# Altium schematic sheet 06-Receiver.SchDoc: Receiver
size A4; Organization: ORGANIZATION; Address1: ADDRESS 1; Address2: ADDRESS 2; Address3: ADDRESS 3; Address4: ADDRESS 4; SheetNumber: 6; SheetTotal: 7; ENG_APP_DATE: --/--/--; DSN_APP_DATE: --/--/--; CHK_APP_DATE: --/--/--
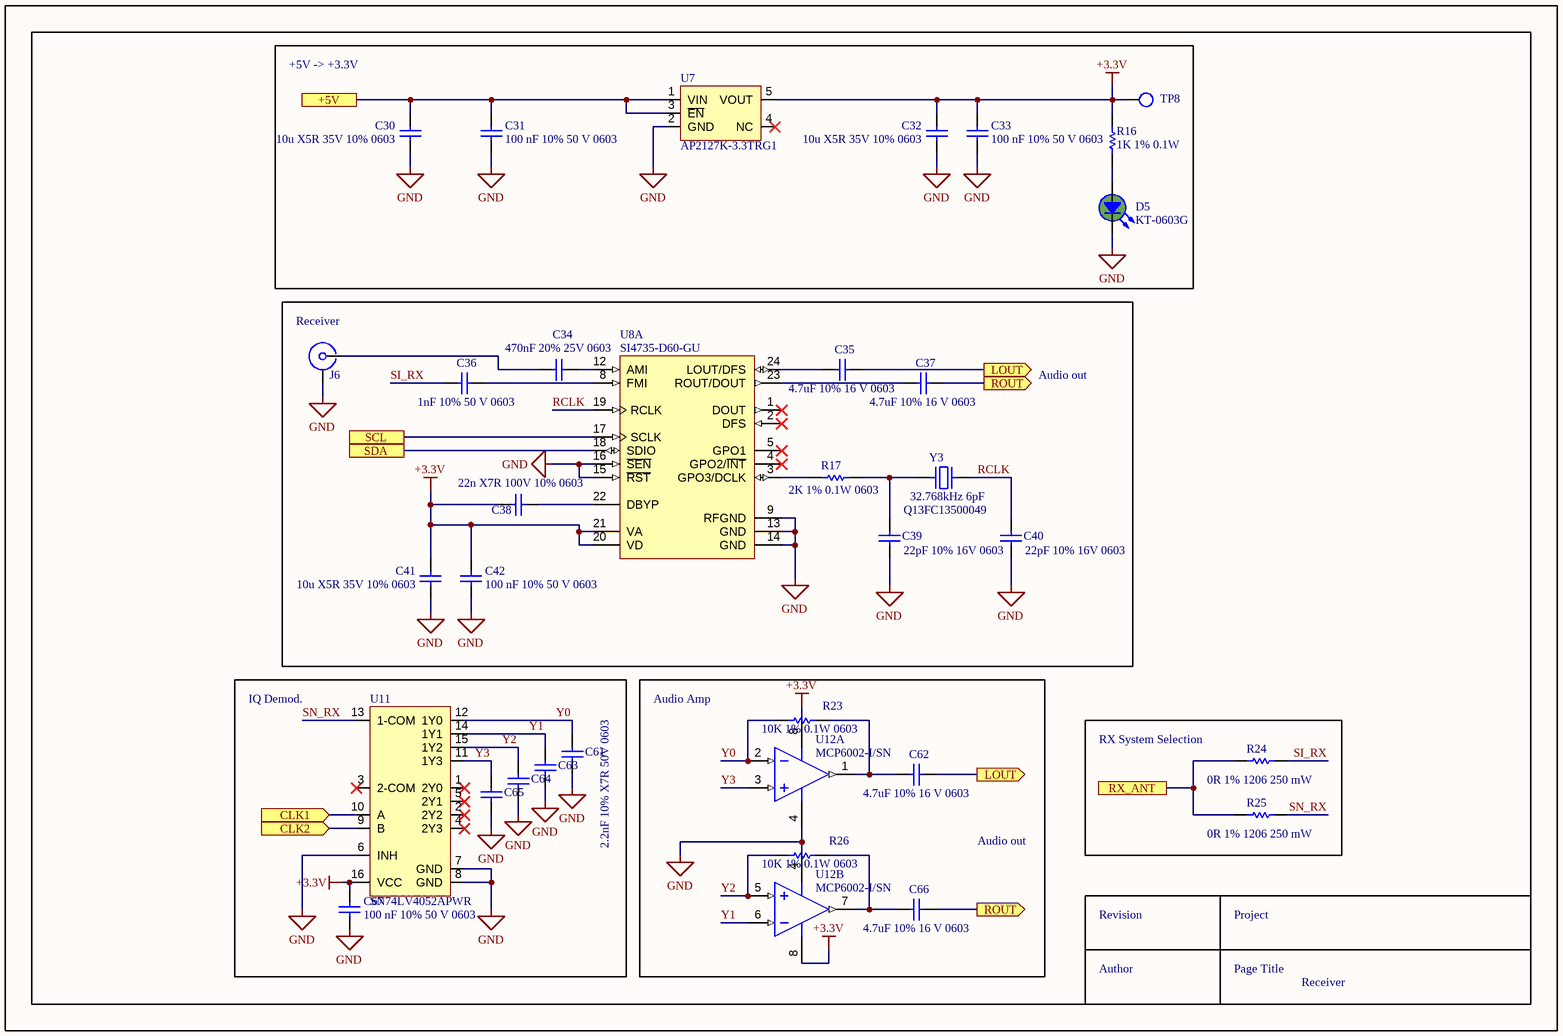
[diagram p0: 06-Receiver.SchDoc]

## Parts
C30  10u X5R 35V 10% 0603  [C0603]
C31  100 nF 10% 50 V 0603  [CAPC1608X90X40NL10T20]
C32  10u X5R 35V 10% 0603  [C0603]
C33  100 nF 10% 50 V 0603  [CAPC1608X90X40NL10T20]
C34  470nF 20% 25V 0603  [CAPC0603(1608)100_L]
C35  4.7uF 10% 16 V 0603  [CAPC1608X90X40NL10T20]
C36  1nF 10% 50 V 0603  [CAPC1608X90X40NL10T20]
C37  4.7uF 10% 16 V 0603  [CAPC1608X90X40NL10T20]
C38  22n X7R 100V 10% 0603  [C0603]
C39  22pF 10% 16V 0603  [CAPC1608X90X40NL10T20]
C40  22pF 10% 16V 0603  [CAPC1608X90X40NL10T20]
C41  10u X5R 35V 10% 0603  [C0603]
C42  100 nF 10% 50 V 0603  [CAPC1608X90X40NL10T20]
C61  2.2nF 10% X7R 50V 0603  [CAPC1608X90X40NL10T20]
C62  4.7uF 10% 16 V 0603  [CAPC1608X90X40NL10T20]
C63  2.2nF 10% X7R 50V 0603  [CAPC1608X90X40NL10T20]  (value not drawn)
C64  2.2nF 10% X7R 50V 0603  [CAPC1608X90X40NL10T20]  (value not drawn)
C65  2.2nF 10% X7R 50V 0603  [CAPC1608X90X40NL10T20]  (value not drawn)
C66  4.7uF 10% 16 V 0603  [CAPC1608X90X40NL10T20]
C67  100 nF 10% 50 V 0603  [CAPC1608X90X40NL10T20]
D5  KT-0603G  [LED-0603-RED]
J6  BWSMA-KE-P001  [TE_CONSMA020.062-G]  (value not drawn)
R16  1K 1% 0.1W  [R0603]
R17  2K 1% 0.1W 0603  [R0603]
R23  10K 1% 0.1W 0603  [R0603]
R24  0R 1% 1206 250 mW  [RESC3116X70X50ML13T20]
R25  0R 1% 1206 250 mW  [RESC3116X70X50ML13T20]
R26  10K 1% 0.1W 0603  [R0603]
TP8  Touchpoint  [Touchpoint-Footprint-1]  (value not drawn)  (no BOM)
U7  AP2127K-3.3TRG1  [FP-SOT25-IPC_B]
U8  SI4735-D60-GU  [SLAB-SSOP-24_N]  (part A of 2)
U11  SN74LV4052APWR  [PW0016A_N]
U12  MCP6002-I/SN  [SOIC-SN8_N]  (parts A,B of 2)
Y3  Q13FC13500049  value 32.768kHz 6pF  [FP-ABS07-120-MFG]

## Blocks framed on the sheet
+5V -> +3.3V: C30-C33 D5 R16 TP8 U7
IQ Demod.: C61 C63-C65 C67 U11
RX System Selection: R24 R25

## Ports
+5V, CLK1 (in), CLK2 (in), LOUT (out), ROUT (out), RX_ANT, SCL, SDA

## Nets
+3.3V: C32.2 C33.2 C38.1 C41.2 C42.2 C67.2 R16.1 TP8.0 U7.5(VOUT) U8.20(VD) U8.21(VA) U11.16(VCC) U12.8(VDD)
GND: C30.1 C31.1 C32.1 C33.1 C39.1 C40.1 C41.1 C42.1 C61.1 C63.1 C64.1 C65.1 C67.1 D5.2 J6.G U7.2(GND) U8.9(RFGND) U8.13(GND) U8.14(GND) U8.15(~{RST}) U8.16(~{SEN}) U11.6(INH) U11.7(GND) U11.8(GND) U12.4(VSS)
+5V: C30.2 C31.2 U7.1(VIN) U7.3(~{EN}) ; port +5V
CLK1: U11.10(A) ; port CLK1
CLK2: U11.9(B) ; port CLK2
LOUT: C35.2 C62.2 ; port LOUT
RCLK: C40.2 U8.19(RCLK) Y3.1
ROUT: C37.2 C66.2 ; port ROUT
RX_ANT: R24.1 R25.1 ; port RX_ANT
SCL: U8.17(SCLK) ; port SCL
SDA: U8.18(SDIO) ; port SDA
SI_RX: C36.1 R24.2
SN_RX: R25.2 U11.13(1-COM)
Y0: C61.2 R23.2 U11.12(1Y0) U12.2(VINA-)
Y1: C63.2 U11.14(1Y1) U12.6(VINB-)
Y2: C64.2 R26.2 U11.15(1Y2) U12.5(VINB+)
Y3: C65.2 U11.11(1Y3) U12.3(VINA+)
NetC34_1: C34.1 J6.1
NetC34_2: C34.2 U8.12(AMI)
NetC35_1: C35.1 U8.24(LOUT/DFS)
NetC36_2: C36.2 U8.8(FMI)
NetC37_1: C37.1 U8.23(ROUT/DOUT)
NetC38_2: C38.2 U8.22(DBYP)
NetC39_2: C39.2 R17.2 Y3.2
NetC62_1: C62.1 R23.1 U12.1(VOUTA)
NetC66_1: C66.1 R26.1 U12.7(VOUTB)
NetD5_1: D5.1 R16.2
NetR17_1: R17.1 U8.3(GPO3/DCLK)

Not connected (* = marked no-connect by the designer): U7 4(NC)*; U8 1(DOUT)* 2(DFS)* 4(GPO2/~{INT})* 5(GPO1)*; U11 1(2Y0)* 2(2Y2)* 3(2-COM)* 4(2Y3)* 5(2Y1)*

## Notes on the sheet
- (near J6) Receiver
- Audio out
- Audio Amp
- Revision
- Project
- Author
- Page Title

## Library data of the parts
C30 C32 C41 = CMP-001-00153-3: MLCC 10u X5R 35V 10% 0603; MFR_Part_#: GRM188R6YA106MA73D; Manufacturer: Generic; Dielectric: X7R; Component Type: Standard; PartNumber: 10u X5R 35V 10% 0603; Value: 10u; LCSC_Part_#: C194427; Tolerance: 10%; Pin Count: 2; Status: Preferred; Source: GT_WH_Control.SCHLIB; Voltage: 35V; LCSC_Price_1ku: 0.0213; Design Item ID: 10u X5R 35V 10% 0603
C31 C33 C42 C67 = CMP-001-00017-8: Chip Capacitor, 100 nF, +/- 10%, 50 V, 0603 (1608 Metric); MFR_Part_#: CC0603KRX7R9BB104; Voltage Rating: 50V; Value: 100nF; Capacitor Type: Ceramic; Mounting Technology: SM; LCSC_Price_1ku: 0.0015; Pins: 2; RoHS Compliant: True; LCSC_Part_#: C14663; Max Operating Temperature: 125°C; Tolerance: 10%; Case/Package: 0603; Min Operating Temperature: -55°C
C34 = CMP-001-00077-4: Chip Capacitor, 470nF +/-20%, 25V, 0603, Thickness 1 mm; Tolerance: 10%; Voltage Rating: 25V; Min Operating Temperature: -55°C; Pins: 2; Value: 470nF; Case/Package: 0603; Max Operating Temperature: 85°C; Mounting Technology: SMT
C35 C37 C62 C66 = CMP-001-00201-1: Chip Capacitor, 4.7uF, +/- 10%, 16V, 0603 (1608 Metric); MFR_Part_#: CL10A475KO8NNNC; Capacitor Type: Ceramic; LCSC_Part_#: C19666; Voltage Rating: 16V; LCSC_Price_1ku: 0.0063; Pins: 2; RoHS Compliant: True; Value: 4.7uF; Case/Package: 0603; Tolerance: 10%; Min Operating Temperature: -55°C; Max Operating Temperature: 125°C; Mounting Technology: SM
C36 = CMP-001-00203-2: Chip Capacitor, 1 nF, 10%, 50 V, 0603 (1608 Metric); MFR_Part_#: CL10B102KB8NNNC; Capacitor Type: Ceramic; Voltage Rating: 50V; LCSC_Price_1ku: 0.0020; Pins: 2; Case/Package: 0603; Min Operating Temperature: -55°C; Mounting Technology: SM; Value: 1nF; Max Operating Temperature: 125°C; RoHS Compliant: True; LCSC_Part_#: C1588; Tolerance: 10%
C38 = CMP-001-00216-2: MLCC 22n X7R 100V 10% 0603; MFR_Part_#: CC0603KRX7R0BB223; Manufacturer: Generic; Voltage: 100V; Source: GT_WH_Control.SCHLIB; Design Item ID: 22n X7R 100V 10% 0603; LCSC_Price_1ku: 0.0071; Component Type: Standard; LCSC_Part_#: C313105; Tolerance: 10%; Dielectric: X7R; Pin Count: 2; Value: 22n; Status: Preferred; PartNumber: 22n X7R 100V 10% 0603
C39 C40 = CMP-001-00207-2: Chip Capacitor, 22pF, 10%, 16V, 0603 (1608 Metric); MFR_Part_#: C0603C220J4GAC7867; Capacitor Type: Ceramic; Pins: 2; Value: 22pF; Min Operating Temperature: -55°C; Voltage Rating: 16V; LCSC_Price_1ku: 0.0209; Mounting Technology: SM; Max Operating Temperature: 125°C; Tolerance: 10%; LCSC_Part_#: C561800; RoHS Compliant: True; Case/Package: 0603
C61 C63-C65 = CMP-001-00213-1: Chip Capacitor, 2.2nF, 10%, 50 V, 0603; MFR_Part_#: CC0603KRX7R9BB222; Voltage Rating: 50V; LCSC_Price_1ku: 0.0021; Case/Package: 0603; LCSC_Part_#: C107082; Value: 2.2nF
D5 = CMP-007-00044-3: 0603 Green LED; MFR_Part_#: KT-0603G; LCSC_Price_1ku: 0.0068; LCSC_Part_#: C12624
J6 = CMP-543-000000-2: 1 Inner Hole SMA Board-End Staggered pins 50Ω 5.2mm SMD Coaxial Connectors (RF) ROHS; MFR: BAT WIRELESS; MFR_Part_#: BWSMA-KE-P001; LCSC_Price_1lu: 0.2065; LCSC_Part_#: C496550
R16 = CMP-009-00312-2: Standard Resistor 1K 1% 0.1W 0603; MFR_Part_#: 0603WAF1001T5E; Manufacturer: Generic; TC: 200; Tolerance: 1%; LCSC_Part_#: C21190; Value: 1K; LCSC_Price_1ku: 0.0007; Power: 0.1W; Pin Count: 2; PartNumber: 1K 1% 0.1W 0603; Design Item ID: 1K 1% 0.1W 0603; Component Type: Standard; Source: GT_WH_Control.SCHLIB
R17 = CMP-009-00329-2: Standard Resistor 2K 1% 0.1W 0603; MFR_Part_#: 0603WAF2001T5E; Manufacturer: Generic; TC: 200; PartNumber: 2K 1% 0.1W 0603; LCSC_Price_1ku: 0.0007; LCSC_Part_#: C22975; Pin Count: 2; Source: GT_WH_Control.SCHLIB; Value: 2K; Component Type: Standard; Design Item ID: 2K 1% 0.1W 0603; Power: 0.1W; Tolerance: 1%
R23 R26 = CMP-356-000043-3: Standard Resistor 10K 1% 0.1W 0603; Manufacturer: Generic; MFR_Part_#: 0603WAF1002T5E; TC: 200; Design Item ID: 10K 1% 0.1W 0603; Tolerance: 1%; LCSC_Price_1ku: 0.0007; Value: 10K; PartNumber: 10K 1% 0.1W 0603; LCSC_Part_#: C25804; Component Type: Standard; Source: GT_WH_Control.SCHLIB; Pin Count: 2; Power: 0.1W
R24 R25 = CMP-009-00008-5: Chip Resistor, 0 Ohm, 0.25 W, -55 to 155 degC, 1206 (3216 Metric); Tolerance: 0.05%; Voltage Rating: 200V; Value: 0; Power: 250mW; Pins: 2; Min Operating Temperature: -55°C; RoHS Compliant: True; Max Operating Temperature: 155°C; Mounting Technology: SM; Case/Package: 1206
TP8 = CMP-001-0002-2: 60mils touchpoint
U7 = CMP-019-00060-1: IC REG LDO 3.3V 0.3A SOT23-5; MFR: Diodes Incorporated; LCSC_Price_1ku: 0.0388; LCSC_Part_#: C156285; MFR_Part_#: AP2127K-3.3TRG1
U8 = CMP-021-00008-1: RF Receiver AM/FM/LW/SW 3.3V/5V Automotive 24-Pin SSOP Tube; MFR: SKYWORKS/SILICON LABS; MFR_Part_#: SI4735-D60-GU; LCSC_Part_#: C1526089; LCSC_Price_1ku: 8.7411
U11 = CMP-016-00014-1: 2 Circuit IC Switch 4:1 75 Ohm 16-TSSOP; MFR: Texas Instruments; LCSC_Part_#: C8142; LCSC_Price_1ku: 0.0974; MFR_Part_#: SN74LV4052APWR
U12 = CMP-014-00007-1: MCP6002 Series 6 V 1 MHz SMT Low-Power Operational Amplifier - SOIC-8; MFR: Microchip Tech; LCSC_Part_#: C116706; MFR_Part_#: MCP6002-I/SN; LCSC_Price_1ku: 0.238
Y3 = CMP-003-00034-2: 32.768kHz Surface Mount Crystal 6pF ±20ppm SMD3215-2P Crystals ROHS; MFR: Seiko Epson; MFR_Part_#: Q13FC13500049; LCSC_Price_1ku: 0.1269; LCSC_Part_#: C95361